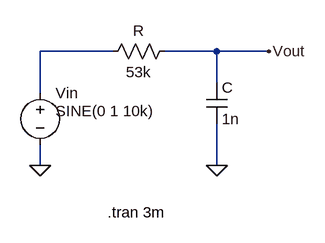
[diagram p0: schematic Low_Pass_Filter.asc]
Low_Pass_Filter.asc, the LTspice schematic file:
Version 4.1
SHEET 1 880 680
WIRE 112 80 0 80
WIRE 272 80 192 80
WIRE 352 80 272 80
WIRE 272 128 272 80
WIRE 0 144 0 80
WIRE 0 256 0 224
WIRE 272 256 272 192
FLAG 272 256 0
FLAG 0 256 0
FLAG 352 80 Vout
SYMBOL res 208 64 R90
WINDOW 0 0 56 VBottom 2
WINDOW 3 32 56 VTop 2
SYMATTR InstName R
SYMATTR Value 53k
SYMBOL cap 256 128 R0
SYMATTR InstName C
SYMATTR Value 1n
SYMBOL voltage 0 128 R0
WINDOW 3 24 44 Left 2
WINDOW 123 24 44 Left 2
WINDOW 39 0 0 Left 0
SYMATTR Value SINE(0 1 10k)
SYMATTR InstName Vin
TEXT 104 328 Left 2 !.tran 3m

The netlist it stands for:
* Low_Pass_Filter.asc
R Vout N001 53k
C Vout 0 1n
Vin N001 0 SINE(0 1 10k)
.tran 3m
.backanno
.end